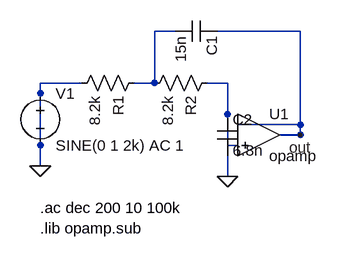
[diagram p0: schematic sallen_key_2k.asc]
sallen_key_2k.asc, the LTspice schematic file:
Version 4
SHEET 1 880 680
WIRE 96 112 32 112
WIRE 32 128 32 112
WIRE 208 112 176 112
WIRE 208 32 208 112
WIRE 208 32 240 32
WIRE 320 112 288 112
WIRE 320 160 320 112
WIRE 336 208 320 208
WIRE 320 208 320 160
WIRE 432 192 400 192
WIRE 432 32 432 192
WIRE 432 32 304 32
WIRE 432 176 400 176
WIRE 432 192 432 176
WIRE 336 176 400 176
WIRE 32 208 32 128
WIRE 32 240 32 208
WIRE 320 256 320 224
FLAG 32 240 0
FLAG 320 256 0
FLAG 432 192 out
SYMBOL voltage 32 112 R0
SYMATTR InstName V1
SYMATTR Value SINE(0 1 2k) AC 1
SYMBOL res 192 96 R90
SYMATTR InstName R1
SYMATTR Value 8.2k
SYMBOL res 304 96 R90
SYMATTR InstName R2
SYMATTR Value 8.2k
SYMBOL cap 304 160 R0
SYMATTR InstName C2
SYMATTR Value 6.8n
SYMBOL cap 304 16 R90
SYMATTR InstName C1
SYMATTR Value 15n
SYMBOL OpAmps\\opamp 368 128 R0
SYMATTR InstName U1
SYMATTR Value opamp
TEXT 32 304 Left 2 !.ac dec 200 10 100k
TEXT 32 336 Left 2 !.lib opamp.sub

The netlist it stands for:
* sallen_key_2k.asc
V1 0 0 SINE(0 1 2k) AC 1
R1 N001 0 8.2k
R2 N002 N001 8.2k
C2 N002 0 6.8n
C1 out N001 15n
XU1 out N002 out opamp Aol=100K GBW=10Meg  ; pins invin noninvin out
.ac dec 200 10 100k
.lib opamp.sub
.backanno
.end